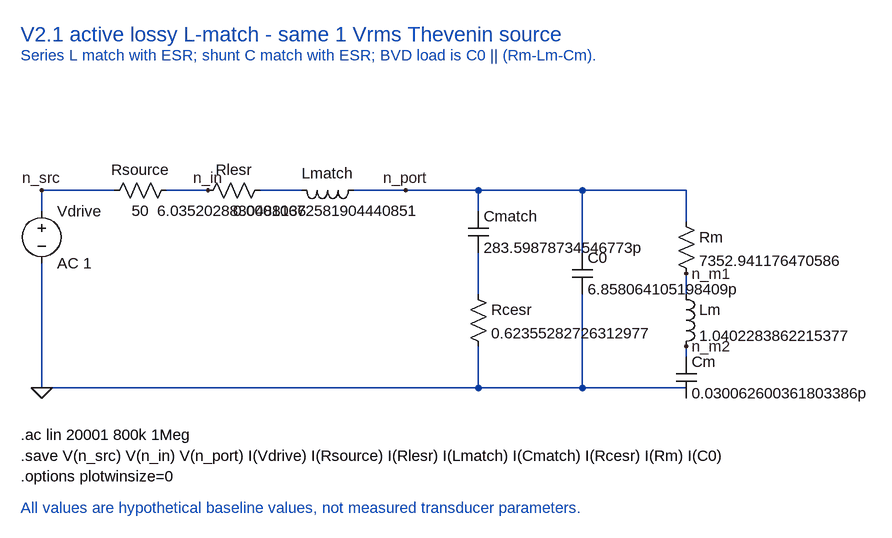
[diagram p0: schematic V2_1_MATCH_ACTIVE_LOSSY.asc]
V2_1_MATCH_ACTIVE_LOSSY.asc, the LTspice schematic file:
Version 4
SHEET 1 1440 880
WIRE 80 304 192 304
WIRE 272 304 336 304
WIRE 416 304 480 304
WIRE 560 304 640 304
WIRE 640 304 752 304
WIRE 752 304 912 304
WIRE 912 304 1072 304
WIRE 80 304 80 336
WIRE 80 416 80 608
WIRE 80 608 752 608
WIRE 752 608 912 608
WIRE 912 608 1072 608
WIRE 752 304 752 336
WIRE 752 400 752 464
WIRE 752 544 752 608
WIRE 912 304 912 400
WIRE 912 464 912 608
WIRE 1072 304 1072 352
WIRE 1072 432 1072 464
WIRE 1072 544 1072 560
WIRE 1072 624 1072 608
FLAG 80 608 0
FLAG 80 304 n_src
FLAG 336 304 n_in
FLAG 640 304 n_port
FLAG 1072 432 n_m1
FLAG 1072 544 n_m2
SYMBOL voltage 80 320 R0
WINDOW 123 24 124 Left 2
WINDOW 39 0 0 Left 0
SYMATTR InstName Vdrive
SYMATTR Value AC 1
SYMBOL res 288 288 R90
WINDOW 0 0 56 VBottom 2
WINDOW 3 32 56 VTop 2
SYMATTR InstName Rsource
SYMATTR Value 50
SYMBOL res 432 288 R90
WINDOW 0 0 56 VBottom 2
WINDOW 3 32 56 VTop 2
SYMATTR InstName Rlesr
SYMATTR Value 6.0352028830488136
SYMBOL ind 576 288 R90
WINDOW 0 5 56 VBottom 2
WINDOW 3 32 56 VTop 2
SYMATTR InstName Lmatch
SYMATTR Value 0.00010672581904440851
SYMBOL cap 736 336 R0
SYMATTR InstName Cmatch
SYMATTR Value 283.59878734546773p
SYMBOL res 736 448 R0
SYMATTR InstName Rcesr
SYMATTR Value 0.62355282726312977
SYMBOL cap 896 400 R0
SYMATTR InstName C0
SYMATTR Value 6.858064105198409p
SYMBOL res 1056 336 R0
SYMATTR InstName Rm
SYMATTR Value 7352.941176470586
SYMBOL ind 1056 448 R0
SYMATTR InstName Lm
SYMATTR Value 1.0402283862215377
SYMBOL cap 1056 560 R0
SYMATTR InstName Cm
SYMATTR Value 0.030062600361803386p
TEXT 48 680 Left 2 !.ac lin 20001 800k 1Meg
TEXT 48 712 Left 2 !.save V(n_src) V(n_in) V(n_port) I(Vdrive) I(Rsource) I(Rlesr) I(Lmatch) I(Cmatch) I(Rcesr) I(Rm) I(C0)
TEXT 48 744 Left 2 !.options plotwinsize=0
TEXT 48 64 Left 3 ;V2.1 active lossy L-match - same 1 Vrms Thevenin source
TEXT 48 96 Left 2 ;Series L match with ESR; shunt C match with ESR; BVD load is C0 || (Rm-Lm-Cm).
TEXT 48 792 Left 2 ;All values are hypothetical baseline values, not measured transducer parameters.

The netlist it stands for:
* V2_1_MATCH_ACTIVE_LOSSY.asc
Vdrive n_src 0 AC 1
Rsource n_in n_src 50
Rlesr N001 n_in 6.0352028830488136
Lmatch n_port N001 0.00010672581904440851
Cmatch n_port N002 283.59878734546773p
Rcesr N002 0 0.62355282726312977
C0 n_port 0 6.858064105198409p
Rm n_port n_m1 7352.941176470586
Lm n_m1 n_m2 1.0402283862215377
Cm n_m2 0 0.030062600361803386p
.ac lin 20001 800k 1Meg
.save V(n_src) V(n_in) V(n_port) I(Vdrive) I(Rsource) I(Rlesr) I(Lmatch) I(Cmatch) I(Rcesr) I(Rm) I(C0)
.options plotwinsize=0
* V2.1 active lossy L-match - same 1 Vrms Thevenin source
* Series L match with ESR; shunt C match with ESR; BVD load is C0 || (Rm-Lm-Cm).
* All values are hypothetical baseline values, not measured transducer parameters.
.backanno
.end